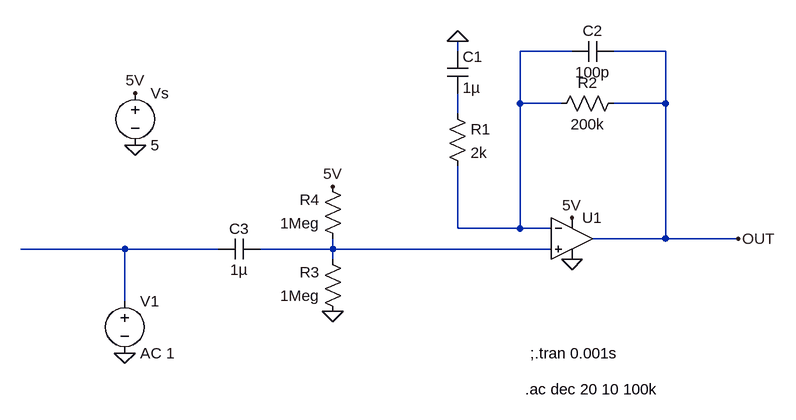
[diagram p0: schematic filter.asc]
filter.asc, the LTspice schematic file:
Version 4
SHEET 1 880 680
WIRE 16 -112 16 -128
WIRE 192 -112 112 -112
WIRE 336 -112 256 -112
WIRE 112 -32 112 -112
WIRE 176 -32 112 -32
WIRE 336 -32 336 -112
WIRE 336 -32 256 -32
WIRE 16 -16 16 -48
WIRE 16 160 16 64
WIRE 112 160 112 -32
WIRE 112 160 16 160
WIRE 160 160 112 160
WIRE 336 176 336 -32
WIRE 336 176 224 176
WIRE 448 176 336 176
WIRE -496 192 -656 192
WIRE -352 192 -496 192
WIRE -176 192 -176 176
WIRE -176 192 -288 192
WIRE 160 192 -176 192
WIRE -176 208 -176 192
WIRE -496 272 -496 192
FLAG 192 208 0
FLAG -480 32 0
FLAG -480 -48 5V
FLAG 192 144 5V
FLAG 16 -128 0
FLAG -496 352 0
FLAG -176 288 0
FLAG -176 96 5V
FLAG 448 176 OUT
SYMBOL OpAmps\\UniversalOpamp2 192 176 R0
SYMATTR InstName U1
SYMATTR Value2 Avol=1Meg GBW=600k Slew=300k
SYMBOL voltage -480 -64 R0
SYMATTR InstName Vs
SYMATTR Value 5
SYMBOL res 0 -32 R0
SYMATTR InstName R1
SYMATTR Value 2k
SYMBOL res 272 -48 R90
WINDOW 0 0 56 VBottom 2
WINDOW 3 32 56 VTop 2
SYMATTR InstName R2
SYMATTR Value 200k
SYMBOL res -160 304 R180
WINDOW 0 36 76 Left 2
WINDOW 3 36 40 Left 2
SYMATTR InstName R3
SYMATTR Value 1Meg
SYMBOL res -160 192 R180
WINDOW 0 36 76 Left 2
WINDOW 3 36 40 Left 2
SYMATTR InstName R4
SYMATTR Value 1Meg
SYMBOL cap 0 -112 R0
SYMATTR InstName C1
SYMATTR Value 1µ
SYMBOL cap 256 -128 R90
WINDOW 0 0 32 VBottom 2
WINDOW 3 32 32 VTop 2
SYMATTR InstName C2
SYMATTR Value 100p
SYMBOL cap -288 176 R90
WINDOW 0 0 32 VBottom 2
WINDOW 3 32 32 VTop 2
SYMATTR InstName C3
SYMATTR Value 1µ
SYMBOL voltage -496 256 R0
WINDOW 123 0 0 Left 0
WINDOW 39 0 0 Left 0
SYMATTR InstName V1
SYMATTR Value AC 1
TEXT 120 408 Left 2 !.ac dec 20 10 100k
TEXT 128 352 Left 2 !;.tran 0.001s

The netlist it stands for:
* filter.asc
XU1 N004 N001 5V 0 OUT level.2 Avol=1Meg GBW=600k Slew=300k ilimit=25m rail=0 Vos=0 phimargin=45 en=0 enk=0 in=0 ink=0 Rin=500Meg  ; pins IN+ IN- V+ V- OUT
Vs 5V 0 5
R1 N002 N001 2k
R2 OUT N001 200k
R3 0 N004 1Meg
R4 N004 5V 1Meg
C1 0 N002 1µ
C2 OUT N001 100p
C3 N004 N003 1µ
V1 N003 0 AC 1
.ac dec 20 10 100k
;.tran 0.001s
.lib UniversalOpamps2.sub
.backanno
.end